# Altium schematic sheet PowerPanel_2_Bucks.SchDoc
size 594 x 420 mm; SheetNumber: 3; SheetTotal: 6
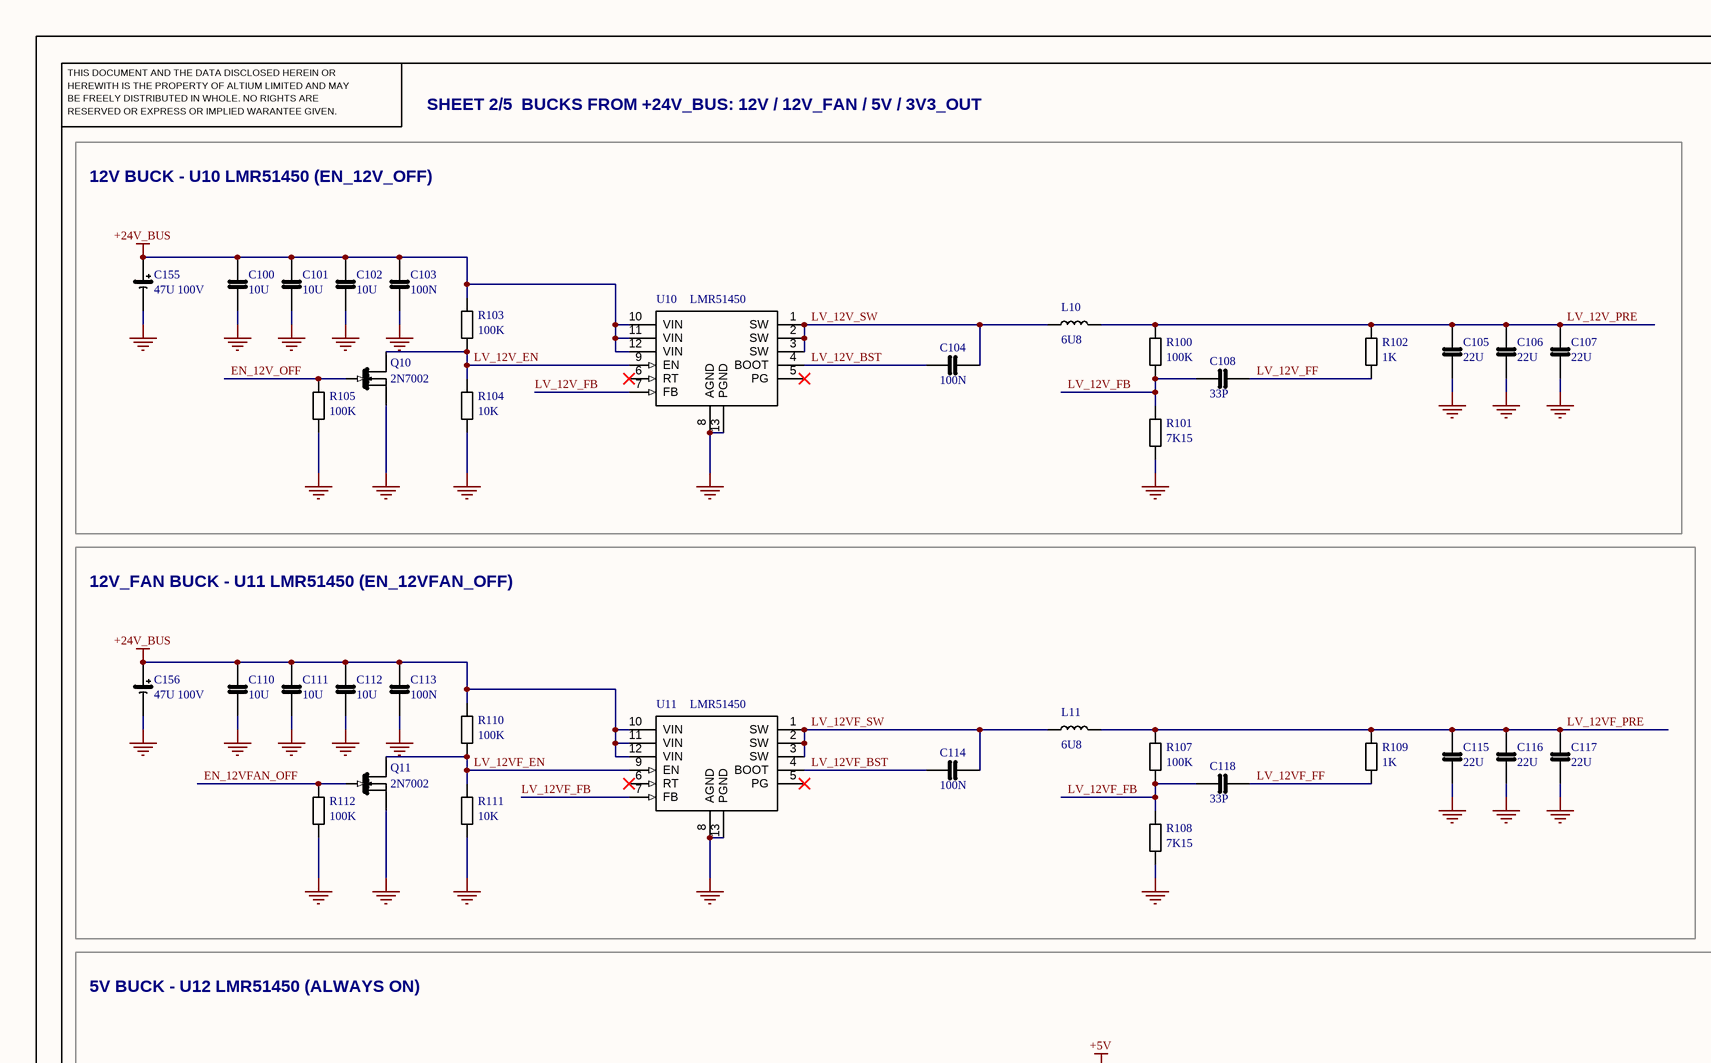
[diagram p0: PowerPanel_2_Bucks.SchDoc, top left]
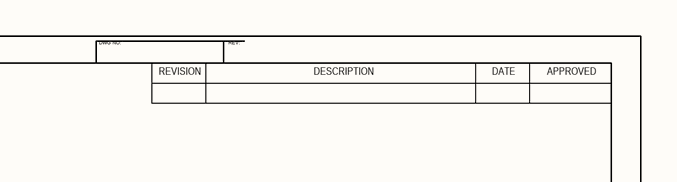
[diagram p1: PowerPanel_2_Bucks.SchDoc, top right]
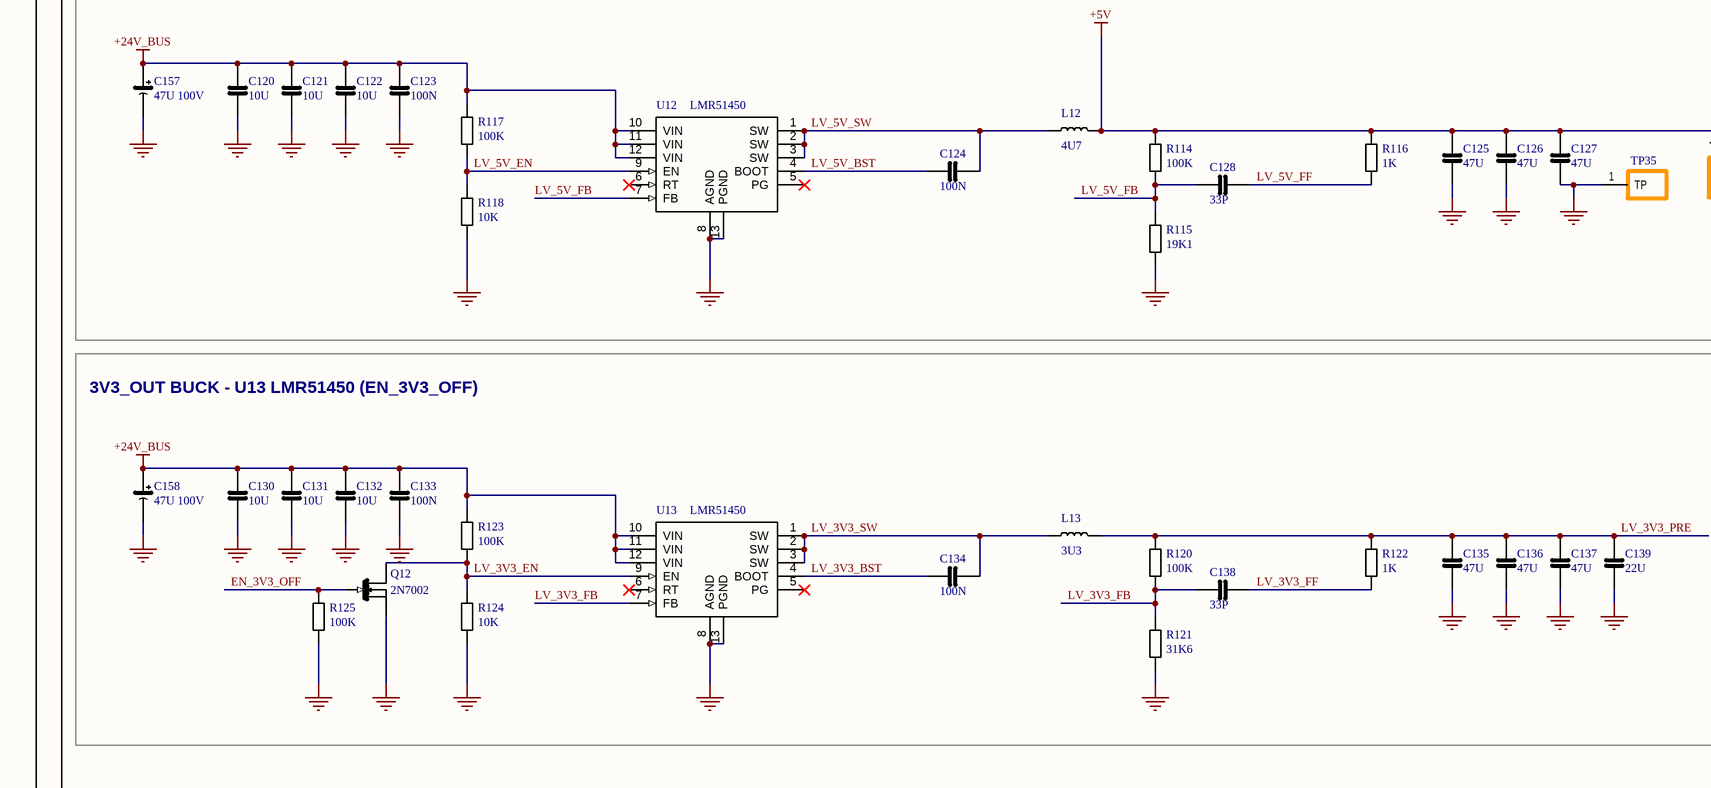
[diagram p2: PowerPanel_2_Bucks.SchDoc, bottom left]
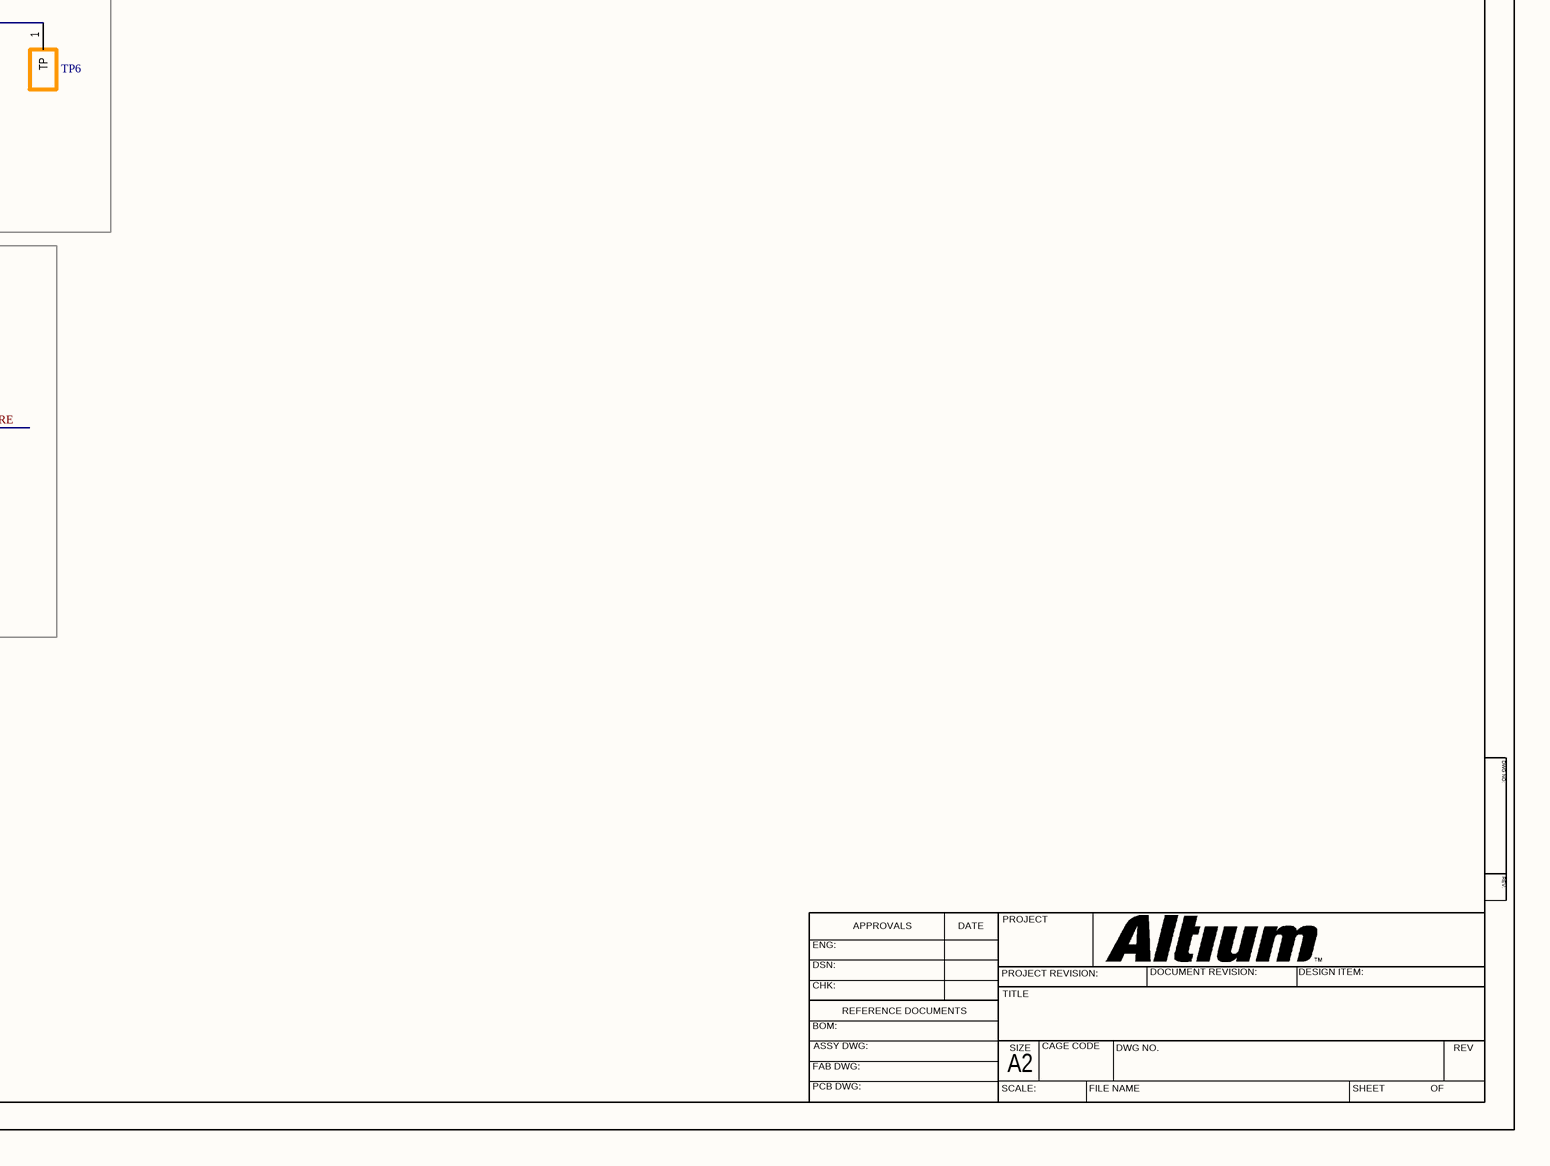
[diagram p3: PowerPanel_2_Bucks.SchDoc, bottom right]

## Parts
C100  10U  [CAP1206]
C101  10U  [CAP1206]
C102  10U  [CAP1206]
C103  100N  [CAP0603]
C104  100N  [CAP0603]
C105  22U  [CAP1206]
C106  22U  [CAP1206]
C107  22U  [CAP1206]
C108  33P  [CAP0603]
C110  10U  [CAP1206]
C111  10U  [CAP1206]
C112  10U  [CAP1206]
C113  100N  [CAP0603]
C114  100N  [CAP0603]
C115  22U  [CAP1206]
C116  22U  [CAP1206]
C117  22U  [CAP1206]
C118  33P  [CAP0603]
C120  10U  [CAP1206]
C121  10U  [CAP1206]
C122  10U  [CAP1206]
C123  100N  [CAP0603]
C124  100N  [CAP0603]
C125  47U  [CAP1206]
C126  47U  [CAP1206]
C127  47U  [CAP1206]
C128  33P  [CAP0603]
C130  10U  [CAP1206]
C131  10U  [CAP1206]
C132  10U  [CAP1206]
C133  100N  [CAP0603]
C134  100N  [CAP0603]
C135  47U  [CAP1206]
C136  47U  [CAP1206]
C137  47U  [CAP1206]
C138  33P  [CAP0603]
C139  22U  [CAP0805]
C155  47U 100V  [CAPAE_D8X10.5]
C156  47U 100V  [CAPAE_D8X10.5]
C157  47U 100V  [CAPAE_D8X10.5]
C158  47U 100V  [CAPAE_D8X10.5]
L10  6U8  [IND_FXL1040]
L11  6U8  [IND_FXL1040]
L12  4U7  [IND_FXL1040]
L13  3U3  [IND_FXL1040]
Q10  2N7002  [SOT-23-3]
Q11  2N7002  [SOT-23-3]
Q12  2N7002  [SOT-23-3]
R100  100K  [R0603]
R101  7K15  [R0603]
R102  1K  [R0603]
R103  100K  [R0603]
R104  10K  [R0603]
R105  100K  [R0603]
R107  100K  [R0603]
R108  7K15  [R0603]
R109  1K  [R0603]
R110  100K  [R0603]
R111  10K  [R0603]
R112  100K  [R0603]
R114  100K  [R0603]
R115  19K1  [R0603]
R116  1K  [R0603]
R117  100K  [R0603]
R118  10K  [R0603]
R120  100K  [R0603]
R121  31K6  [R0603]
R122  1K  [R0603]
R123  100K  [R0603]
R124  10K  [R0603]
R125  100K  [R0603]
TP6  TP  [TESTPOINT]  (value not drawn)
TP35  TP  [TESTPOINT]  (value not drawn)
U10  LMR51450  [WSON-12_3X3_EP]
U11  LMR51450  [WSON-12_3X3_EP]
U12  LMR51450  [WSON-12_3X3_EP]
U13  LMR51450  [WSON-12_3X3_EP]

## Blocks framed on the sheet
12V BUCK - U10 LMR51450 (EN_12V_OFF): C100-C108 C155 L10 Q10 R100-R105 U10
12V_FAN BUCK - U11 LMR51450 (EN_12VFAN_OFF): C110-C118 C156 L11 Q11 R107-R112 U11
5V BUCK - U12 LMR51450 (ALWAYS ON): C120-C128 C157 L12 R114-R118 TP6 TP35 U12
3V3_OUT BUCK - U13 LMR51450 (EN_3V3_OFF): C130-C139 C158 L13 Q12 R120-R125 U13

## Nets
+5V: C125.1 C126.1 C127.1 L12.2 R114.1 R116.1 TP6.1(TP)
+24V_BUS: C100.1 C101.1 C102.1 C103.1 C110.1 C111.1 C112.1 C113.1 C120.1 C121.1 C122.1 C123.1 C130.1 C131.1 C132.1 C133.1 C155.1(+) C156.1(+) C157.1(+) C158.1(+) R103.1 R110.1 R117.1 R123.1 U10.10(VIN) U10.11(VIN) U10.12(VIN) U11.10(VIN) U11.11(VIN) U11.12(VIN) U12.10(VIN) U12.11(VIN) U12.12(VIN) U13.10(VIN) U13.11(VIN) U13.12(VIN)
GND: C100.2 C101.2 C102.2 C103.2 C105.2 C106.2 C107.2 C110.2 C111.2 C112.2 C113.2 C115.2 C116.2 C117.2 C120.2 C121.2 C122.2 C123.2 C125.2 C126.2 C127.2 C130.2 C131.2 C132.2 C133.2 C135.2 C136.2 C137.2 C139.2 C155.2(-) C156.2(-) C157.2(-) C158.2(-) Q10.2(S) Q11.2(S) Q12.2(S) R101.2 R104.2 R105.2 R108.2 R111.2 R112.2 R115.2 R118.2 R121.2 R124.2 R125.2 TP35.1(TP) U10.8(AGND) U10.13(PGND) U11.8(AGND) U11.13(PGND) U12.8(AGND) U12.13(PGND) U13.8(AGND) U13.13(PGND)
EN_3V3_OFF: Q12.1(G) R125.1
EN_12V_OFF: Q10.1(G) R105.1
EN_12VFAN_OFF: Q11.1(G) R112.1
LV_3V3_BST: C134.1 U13.4(BOOT)
LV_3V3_EN: Q12.3(D) R123.2 R124.1 U13.9(EN)
LV_3V3_FB: C138.2 R120.2 R121.1 U13.7(FB)
LV_3V3_FF: C138.1 R122.2
LV_3V3_PRE: C135.1 C136.1 C137.1 C139.1 L13.2 R120.1 R122.1
LV_3V3_SW: C134.2 L13.1 U13.1(SW) U13.2(SW) U13.3(SW)
LV_5V_BST: C124.1 U12.4(BOOT)
LV_5V_EN: R117.2 R118.1 U12.9(EN)
LV_5V_FB: C128.2 R114.2 R115.1 U12.7(FB)
LV_5V_FF: C128.1 R116.2
LV_5V_SW: C124.2 L12.1 U12.1(SW) U12.2(SW) U12.3(SW)
LV_12V_BST: C104.1 U10.4(BOOT)
LV_12V_EN: Q10.3(D) R103.2 R104.1 U10.9(EN)
LV_12V_FB: C108.2 R100.2 R101.1 U10.7(FB)
LV_12V_FF: C108.1 R102.2
LV_12V_PRE: C105.1 C106.1 C107.1 L10.2 R100.1 R102.1
LV_12V_SW: C104.2 L10.1 U10.1(SW) U10.2(SW) U10.3(SW)
LV_12VF_BST: C114.1 U11.4(BOOT)
LV_12VF_EN: Q11.3(D) R110.2 R111.1 U11.9(EN)
LV_12VF_FB: C118.2 R107.2 R108.1 U11.7(FB)
LV_12VF_FF: C118.1 R109.2
LV_12VF_PRE: C115.1 C116.1 C117.1 L11.2 R107.1 R109.1
LV_12VF_SW: C114.2 L11.1 U11.1(SW) U11.2(SW) U11.3(SW)

Not connected (* = marked no-connect by the designer): U10 5(PG)* 6(RT)*; U11 5(PG)* 6(RT)*; U12 5(PG)* 6(RT)*; U13 5(PG)* 6(RT)*

## Notes on the sheet
- DWG NO:
- REV:
- THIS DOCUMENT AND THE DATA DISCLOSED HEREIN OR
- HEREWITH IS THE PROPERTY OF ALTIUM LIMITED AND MAY
- BE FREELY DISTRIBUTED IN WHOLE. NO RIGHTS ARE
- RESERVED OR EXPRESS OR IMPLIED WARANTEE GIVEN.
- SHEET 2/5  BUCKS FROM +24V_BUS: 12V / 12V_FAN / 5V / 3V3_OUT
- REVISION
- DESCRIPTION
- DATE
- APPROVED
- ENG:
- APPROVALS
- PROJECT
- DSN:
- CHK:
- REFERENCE DOCUMENTS
- PROJECT REVISION:
- TITLE
- DOCUMENT REVISION:
- DESIGN ITEM:
- BOM:
- FAB DWG:
- PCB DWG:
- ASSY DWG:
- SCALE:
- A2
- SIZE
- CAGE CODE
- FILE NAME
- DWG NO.
- SHEET
- OF
- REV

## Library data of the parts
C100-C102 C110-C112 C120-C122 C130-C132 = C_10U_1206: CAP // 10U // 50V // X5R // 1206; MFR: Samsung Electro-Mechanics; MPN: CL31A106KBHNNNE; Value: 10U; LCSC: C13585; JLC_TYPE: BASIC; JLC_CHECKED: 2026-09-29 STOCK 2442079; Datasheet: https://www.lcsc.com/datasheet/lcsc_datasheet_2304140030_Samsung-Electro-Mechanics-CL31A106KBHNNNE_C13585.pdf
C103 C104 C113 C114 C123 C124 C133 C134 = C_100N_0603: CAP // 100N // 50V // X7R // 0603; MFR: YAGEO; MPN: CC0603KRX7R9BB104; Value: 100N; LCSC: C14663; JLC_TYPE: BASIC; JLC_CHECKED: 2026-09-29 STOCK 55887132; Datasheet: https://www.lcsc.com/datasheet/lcsc_datasheet_2211101700_YAGEO-CC0603KRX7R9BB104_C14663.pdf
C105-C107 C115-C117 = C_22U_1206: CAP // 22U // 25V // X5R // 1206; MFR: Samsung Electro-Mechanics; MPN: CL31A226KAHNNNE; Value: 22U; LCSC: C12891; JLC_TYPE: BASIC; JLC_CHECKED: 2026-10-03 STOCK 585151; Datasheet: https://www.lcsc.com/datasheet/lcsc_datasheet_2304140030_Samsung-Electro-Mechanics-CL31A226KAHNNNE_C12891.pdf
C108 C118 C128 C138 = C_33P_0603: CAP // 33P // 50V // C0G // 0603; MFR: Samsung Electro-Mechanics; MPN: CL10C330JB8NNNC; Value: 33P; LCSC: C1663; JLC_TYPE: BASIC; JLC_CHECKED: 2026-10-03 STOCK 1028975; Datasheet: https://www.lcsc.com/datasheet/lcsc_datasheet_2304140030_Samsung-Electro-Mechanics-CL10C330JB8NNNC_C1663.pdf
C125-C127 C135-C137 = C_47U_1206: CAP // 47U // 10V // X5R // 1206; MFR: Samsung Electro-Mechanics; MPN: CL31A476MPHNNNE; Value: 47U; LCSC: C96123; JLC_TYPE: BASIC; JLC_CHECKED: 2026-09-29 STOCK 316228; Datasheet: https://www.lcsc.com/datasheet/lcsc_datasheet_2304140030_Samsung-Electro-Mechanics-CL31A476MPHNNNE_C96123.pdf
C139 = C_22U_0805: CAP // 22U // 25V // X5R // 0805; MFR: Samsung Electro-Mechanics; MPN: CL21A226MAQNNNE; Value: 22U; LCSC: C45783; JLC_TYPE: BASIC; JLC_CHECKED: 2026-09-29 STOCK 4065880; Datasheet: https://www.lcsc.com/datasheet/lcsc_datasheet_2304140030_Samsung-Electro-Mechanics-CL21A226MAQNNNE_C45783.pdf
C155-C158 = CP_47U_100V_8X10: CAP ALU // 47U // 100V // 20% // 105C // SMD D8X10.5; MFR: jieerrui; MPN: RV100V47M8X10; Value: 47U; LCSC: C48935391; JLC_TYPE: EXTENDED; JLC_CHECKED: 2026-10-03 STOCK 115676; Datasheet: https://www.lcsc.com/datasheet/lcsc_datasheet_2505151725_jieerrui-RV100V47M8X10_C48935391.pdf
L10 L11 = L_6U8_1040: IND // 6U8 // ISAT 9.6A // IRMS 7A // 25MR // 1040 MOLDED; MFR: cjiang (Changjiang Microelectronics Tech); MPN: FXL1040-6R8-M; Value: 6U8; LCSC: C167231; JLC_TYPE: EXTENDED; JLC_CHECKED: 2026-10-03 STOCK 13168; Datasheet: https://www.lcsc.com/datasheet/lcsc_datasheet_2404260921_cjiang--Changjiang-Microelectronics-Tech-FXL1040-6R8-M_C167231.pdf
L12 = L_4U7_1040: IND // 4U7 // ISAT 10.4A // IRMS 7.5A // 20MR // 1040 MOLDED; MFR: cjiang (Changjiang Microelectronics Tech); MPN: FXL1040-4R7-M; Value: 4U7; LCSC: C167230; JLC_TYPE: EXTENDED; JLC_CHECKED: 2026-10-03 STOCK 4281; Datasheet: https://www.lcsc.com/datasheet/lcsc_datasheet_2404260921_cjiang--Changjiang-Microelectronics-Tech-FXL1040-4R7-M_C167230.pdf
L13 = L_3U3_1040: IND // 3U3 // ISAT 12.8A // IRMS 9.5A // 11.8MR // 1040 MOLDED; MFR: cjiang (Changjiang Microelectronics Tech); MPN: FXL1040-3R3-M; Value: 3U3; LCSC: C167229; JLC_TYPE: EXTENDED; JLC_CHECKED: 2026-10-03 STOCK 5757; Datasheet: https://www.lcsc.com/datasheet/lcsc_datasheet_2404260921_cjiang--Changjiang-Microelectronics-Tech-FXL1040-3R3-M_C167229.pdf
Q10-Q12 = Q_2N7002: NMOS // 60V // 115MA // 5R@10V // SOT-23; MFR: Jiangsu Changjing Electronics Technology Co., Ltd.; Value: 2N7002; MPN: 2N7002; LCSC: C8545; JLC_TYPE: BASIC; JLC_CHECKED: 2026-09-29 STOCK 1679919; Datasheet: https://www.lcsc.com/datasheet/lcsc_datasheet_2304140030_Jiangsu-Changjing-Electronics-Technology-Co---Ltd--2N7002_C8545.pdf
R100 R103 R105 R107 R110 R112 R114 R117 R120 R123 R125 = R_100K_0603: RES // 100K // 1% // 100MW // 0603; MFR: UNI-ROYAL(Uniroyal Elec); MPN: 0603WAF1003T5E; Value: 100K; LCSC: C25803; JLC_TYPE: BASIC; JLC_CHECKED: 2026-09-29 STOCK 22429301; Datasheet: https://www.lcsc.com/datasheet/lcsc_datasheet_2206010045_UNI-ROYAL-Uniroyal-Elec-0603WAF1003T5E_C25803.pdf
R101 R108 = R_7K15_0603: RES // 7K15 // 1% // 100MW // 0603; MFR: UNI-ROYAL(Uniroyal Elec); MPN: 0603WAF7151T5E; Value: 7K15; LCSC: C25980; JLC_TYPE: EXTENDED; JLC_CHECKED: 2026-10-03 STOCK 8144; Datasheet: https://www.lcsc.com/datasheet/lcsc_datasheet_2206010045_UNI-ROYAL-Uniroyal-Elec-0603WAF7151T5E_C25980.pdf
R102 R109 R116 R122 = R_1K_0603: RES // 1K // 1% // 100MW // 0603; MFR: UNI-ROYAL(Uniroyal Elec); MPN: 0603WAF1001T5E; Value: 1K; LCSC: C21190; JLC_TYPE: BASIC; JLC_CHECKED: 2026-09-29 STOCK 22360355; Datasheet: https://www.lcsc.com/datasheet/lcsc_datasheet_2206010130_UNI-ROYAL-Uniroyal-Elec-0603WAF1001T5E_C21190.pdf
R104 R111 R118 R124 = R_10K_0603: RES // 10K // 1% // 100MW // 0603; MFR: UNI-ROYAL(Uniroyal Elec); MPN: 0603WAF1002T5E; Value: 10K; LCSC: C25804; JLC_TYPE: BASIC; JLC_CHECKED: 2026-09-29 STOCK 21309815; Datasheet: https://www.lcsc.com/datasheet/lcsc_datasheet_2206010045_UNI-ROYAL-Uniroyal-Elec-0603WAF1002T5E_C25804.pdf
R115 = R_19K1_0603: RES // 19K1 // 1% // 100MW // 0603; MFR: UNI-ROYAL(Uniroyal Elec); MPN: 0603WAF1912T5E; Value: 19K1; LCSC: C22897; JLC_TYPE: EXTENDED; JLC_CHECKED: 2026-10-03 STOCK 64956; Datasheet: https://www.lcsc.com/datasheet/lcsc_datasheet_2206010130_UNI-ROYAL-Uniroyal-Elec-0603WAF1912T5E_C22897.pdf
R121 = R_31K6_0603: RES // 31K6 // 1% // 100MW // 0603; MFR: UNI-ROYAL(Uniroyal Elec); MPN: 0603WAF3162T5E; Value: 31K6; LCSC: C25967; JLC_TYPE: EXTENDED; JLC_CHECKED: 2026-10-03 STOCK 116347; Datasheet: https://www.lcsc.com/datasheet/lcsc_datasheet_2206010045_UNI-ROYAL-Uniroyal-Elec-0603WAF3162T5E_C25967.pdf
TP6 TP35 = TP: TP // SMD PAD // 1.5MM; MPN: TEST POINT (NOT A BOM PART)
U10-U13 = U_LMR51450: BUCK // 4V-36V IN // 5A // 500KHZ // SYNC PFM // WSON-12; MFR: Texas Instruments; MPN: LMR51450SDRRR; Value: LMR51450; LCSC: C6890985; JLC_TYPE: EXTENDED; JLC_CHECKED: 2026-10-03 STOCK 16947; Datasheet: https://wmsc.lcsc.com/wmsc/upload/file/pdf/v2/lcsc/2402291910_Texas-Instruments-LMR51450SDRRR_C6890985.pdf